# Altium schematic sheet S6_Can_SPI_Uart_Ports.SchDoc
size 420 x 297 mm; SheetNumber: 6; SheetTotal: 7
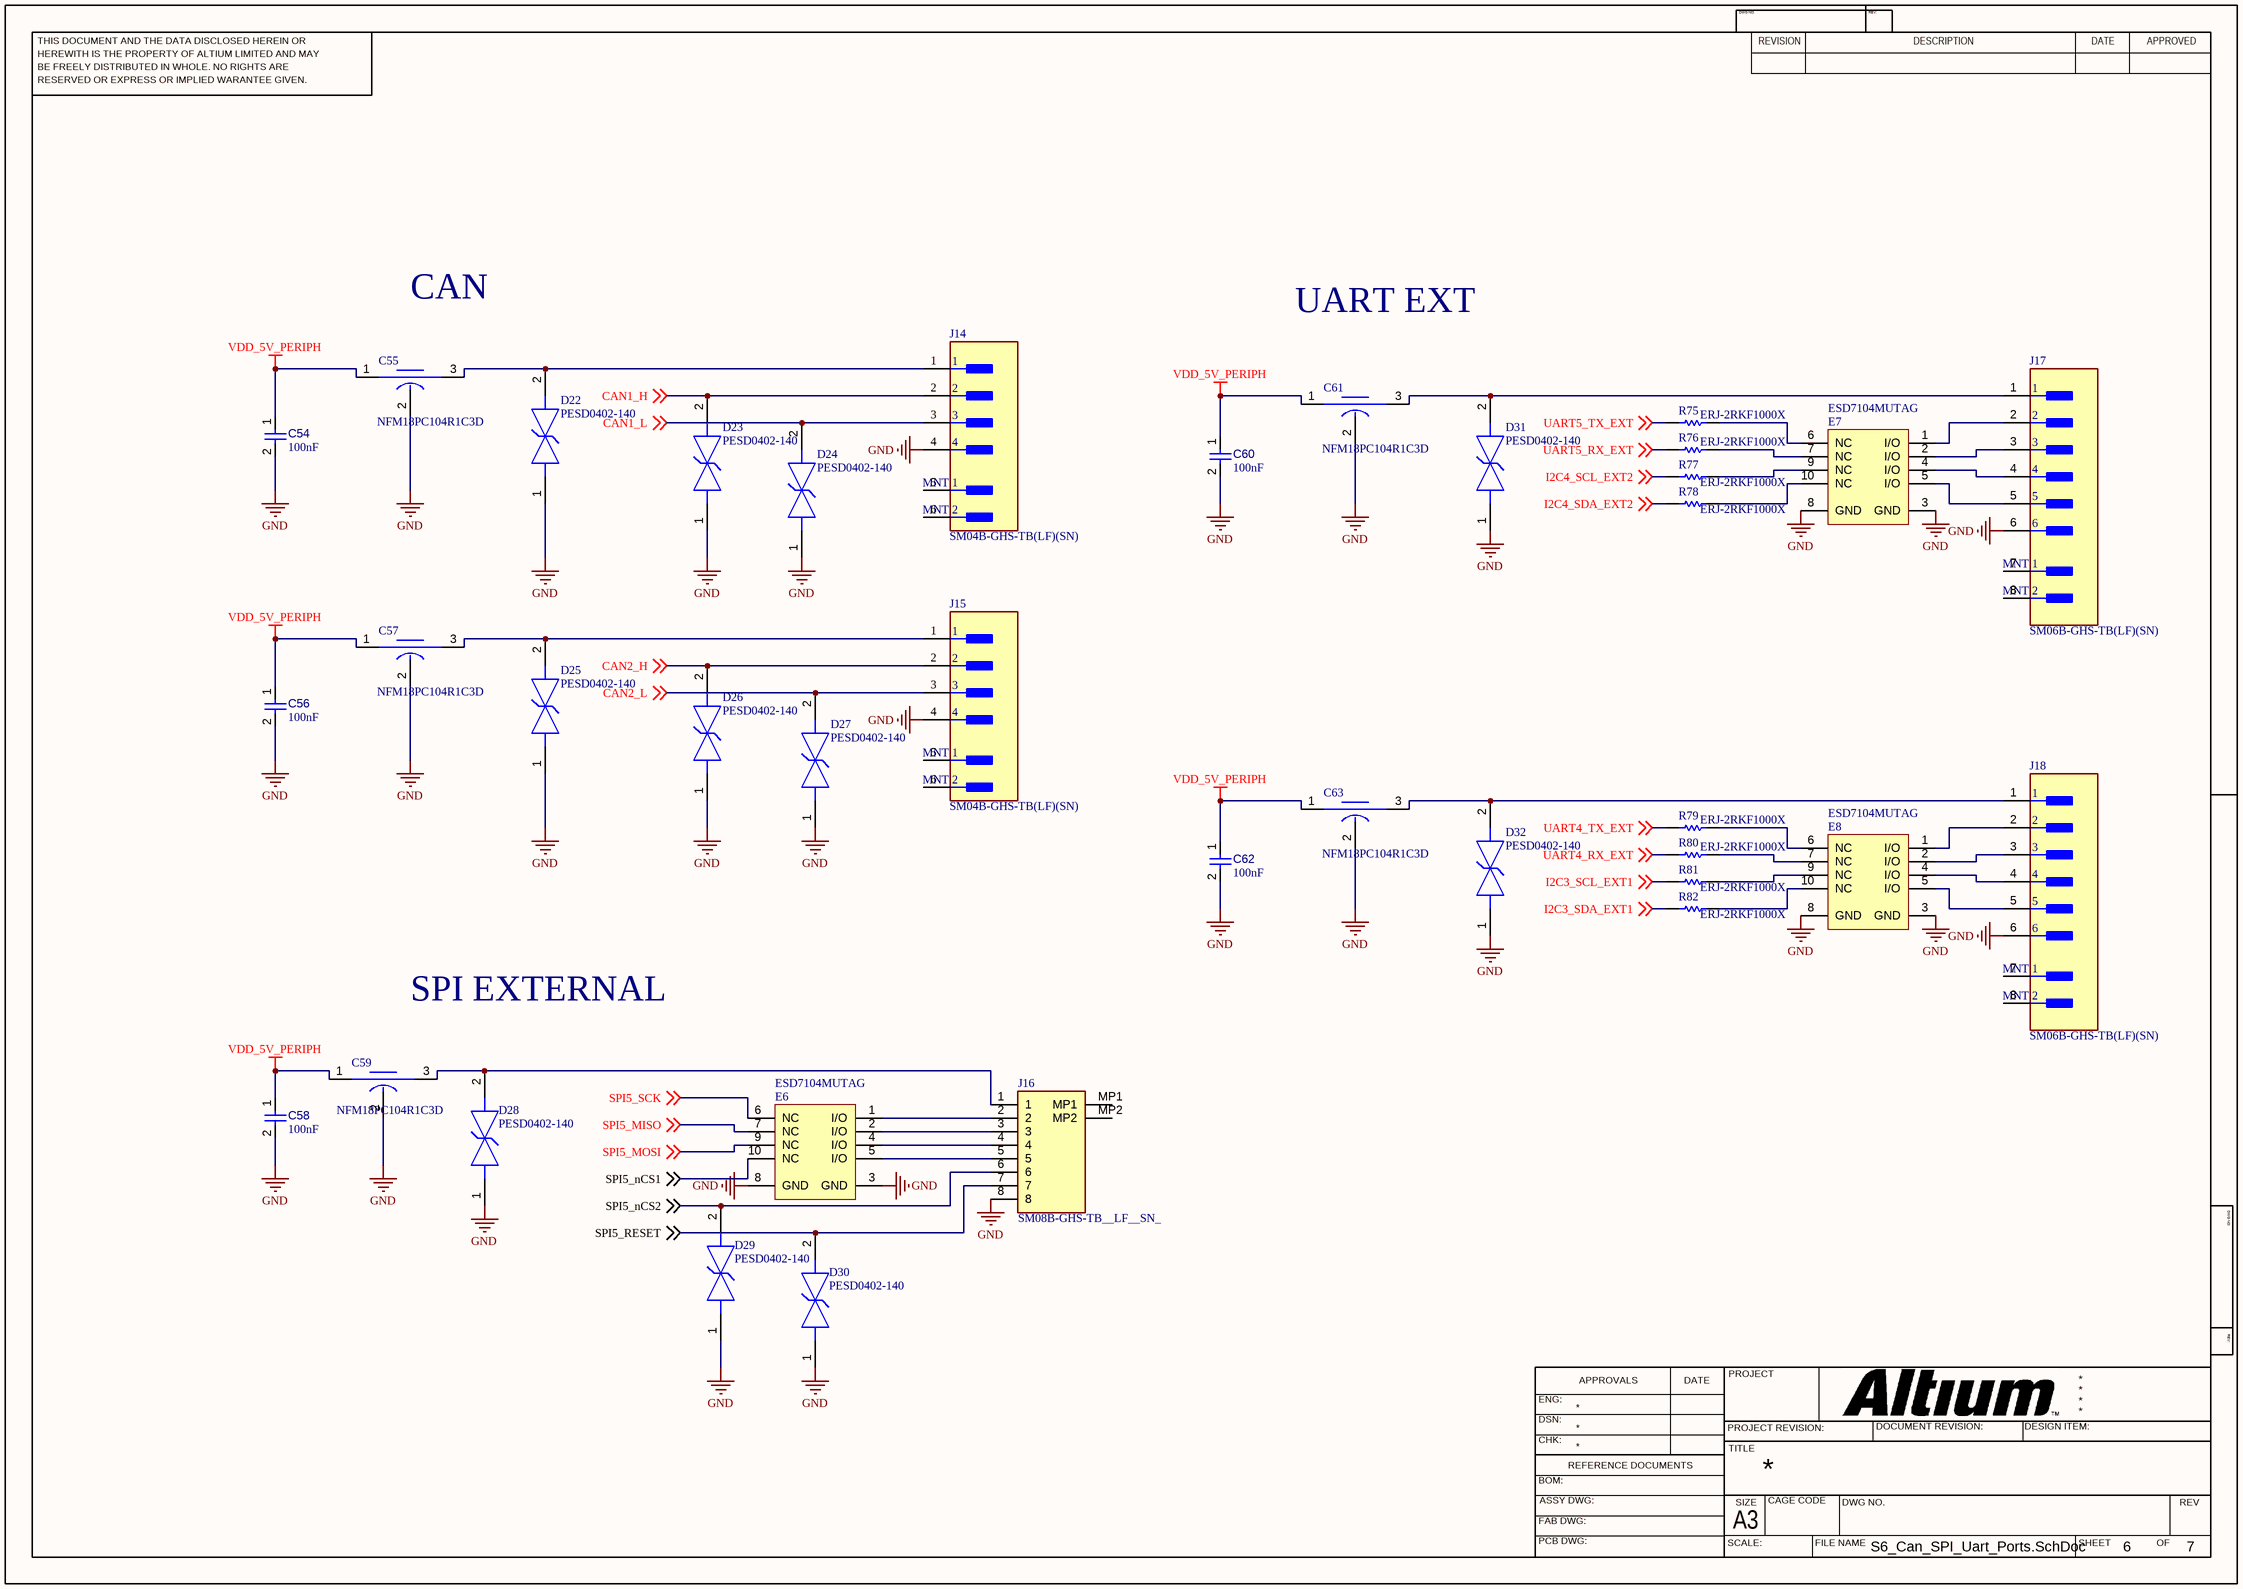
[diagram p0: S6_Can_SPI_Uart_Ports.SchDoc]

## Parts
C54  value 100nF  [CAPC0402(1005)60_L]  (hidden comment: Capacitor 100nF +/-20% 25V 0402)
C55  NFM18PC104R1C3D  [FP-NFM18-0_1-e0_15_0_35-MFG]
C56  value 100nF  [CAPC0402(1005)60_L]  (hidden comment: Capacitor 100nF +/-20% 25V 0402)
C57  NFM18PC104R1C3D  [FP-NFM18-0_1-e0_15_0_35-MFG]
C58  value 100nF  [CAPC0402(1005)60_L]  (hidden comment: Capacitor 100nF +/-20% 25V 0402)
C59  NFM18PC104R1C3D  [FP-NFM18-0_1-e0_15_0_35-MFG]
C60  value 100nF  [CAPC0402(1005)60_L]  (hidden comment: Capacitor 100nF +/-20% 25V 0402)
C61  NFM18PC104R1C3D  [FP-NFM18-0_1-e0_15_0_35-MFG]
C62  value 100nF  [CAPC0402(1005)60_L]  (hidden comment: Capacitor 100nF +/-20% 25V 0402)
C63  NFM18PC104R1C3D  [FP-NFM18-0_1-e0_15_0_35-MFG]
D22  PESD0402-140  [FP-PESD0402-MFG]
D23  PESD0402-140  [FP-PESD0402-MFG]
D24  PESD0402-140  [FP-PESD0402-MFG]
D25  PESD0402-140  [FP-PESD0402-MFG]
D26  PESD0402-140  [FP-PESD0402-MFG]
D27  PESD0402-140  [FP-PESD0402-MFG]
D28  PESD0402-140  [FP-PESD0402-MFG]
D29  PESD0402-140  [FP-PESD0402-MFG]
D30  PESD0402-140  [FP-PESD0402-MFG]
D31  PESD0402-140  [FP-PESD0402-MFG]
D32  PESD0402-140  [FP-PESD0402-MFG]
E6  ESD7104MUTAG  [ONSC-UDFN-10-517BB-01_V]
E7  ESD7104MUTAG  [ONSC-UDFN-10-517BB-01_V]
E8  ESD7104MUTAG  [ONSC-UDFN-10-517BB-01_V]
J14  SM04B-GHS-TB(LF)(SN)  [FP-SM04B-GHS-TB_LF_SN-MFG]
J15  SM04B-GHS-TB(LF)(SN)  [FP-SM04B-GHS-TB_LF_SN-MFG]
J16  SM08B-GHS-TB__LF__SN_  [SM08BGHSTBLFSN]
J17  SM06B-GHS-TB(LF)(SN)  [FP-SM06B-GHS-TB_LF_SN-MFG]
J18  SM06B-GHS-TB(LF)(SN)  [FP-SM06B-GHS-TB_LF_SN-MFG]
R75  ERJ-2RKF1000X  [RESC1005X40X25LL05T05]
R76  ERJ-2RKF1000X  [RESC1005X40X25LL05T05]
R77  ERJ-2RKF1000X  [RESC1005X40X25LL05T05]
R78  ERJ-2RKF1000X  [RESC1005X40X25LL05T05]
R79  ERJ-2RKF1000X  [RESC1005X40X25LL05T05]
R80  ERJ-2RKF1000X  [RESC1005X40X25LL05T05]
R81  ERJ-2RKF1000X  [RESC1005X40X25LL05T05]
R82  ERJ-2RKF1000X  [RESC1005X40X25LL05T05]

## Nets
GND: C54.2 C55.2(GND) C56.2 C57.2(GND) C58.2 C59.2(GND) C60.2 C61.2(GND) C62.2 C63.2(GND) D22.1 D23.1 D24.1 D25.1 D26.1 D27.1 D28.1 D29.1 D30.1 D31.1 D32.1 E6.3(GND) E6.8(GND) E7.3(GND) E7.8(GND) E8.3(GND) E8.8(GND) J14.4 J15.4 J16.8 J17.6 J18.6
VDD_5V_PERIPH: C54.1 C55.1(Input) C56.1 C57.1(Input) C58.1 C59.1(Input) C60.1 C61.1(Input) C62.1 C63.1(Input)
CAN1_H: D23.2 J14.2 ; off-sheet CAN1_H
CAN1_L: D24.2 J14.3 ; off-sheet CAN1_L
CAN2_H: D26.2 J15.2 ; off-sheet CAN2_H
CAN2_L: D27.2 J15.3 ; off-sheet CAN2_L
I2C3_SCL_EXT1: R81.1 ; off-sheet I2C3_SCL_EXT1
I2C3_SDA_EXT1: R82.1 ; off-sheet I2C3_SDA_EXT1
I2C4_SCL_EXT2: R77.1 ; off-sheet I2C4_SCL_EXT2
I2C4_SDA_EXT2: R78.1 ; off-sheet I2C4_SDA_EXT2
SPI5_MISO: E6.7(NC) ; off-sheet SPI5_MISO
SPI5_MOSI: E6.9(NC) ; off-sheet SPI5_MOSI
SPI5_nCS1: E6.10(NC) ; off-sheet SPI5_nCS1
SPI5_nCS2: D29.2 J16.6 ; off-sheet SPI5_nCS2
SPI5_RESET: D30.2 J16.7 ; off-sheet SPI5_RESET
SPI5_SCK: E6.6(NC) ; off-sheet SPI5_SCK
UART4_RX_EXT: R80.1 ; off-sheet UART4_RX_EXT
UART4_TX_EXT: R79.1 ; off-sheet UART4_TX_EXT
UART5_RX_EXT: R76.1 ; off-sheet UART5_RX_EXT
UART5_TX_EXT: R75.1 ; off-sheet UART5_TX_EXT
NetC55_3: C55.3(Output) D22.2 J14.1
NetC57_3: C57.3(Output) D25.2 J15.1
NetC59_3: C59.3(Output) D28.2 J16.1
NetC61_3: C61.3(Output) D31.2 J17.1
NetC63_3: C63.3(Output) D32.2 J18.1
NetE6_1: E6.1(I/O) J16.2
NetE6_2: E6.2(I/O) J16.3
NetE6_4: E6.4(I/O) J16.4
NetE6_5: E6.5(I/O) J16.5
NetE7_1: E7.1(I/O) J17.2
NetE7_2: E7.2(I/O) J17.3
NetE7_4: E7.4(I/O) J17.4
NetE7_5: E7.5(I/O) J17.5
NetE7_6: E7.6(NC) R75.2
NetE7_7: E7.7(NC) R76.2
NetE7_9: E7.9(NC) R77.2
NetE7_10: E7.10(NC) R78.2
NetE8_1: E8.1(I/O) J18.2
NetE8_2: E8.2(I/O) J18.3
NetE8_4: E8.4(I/O) J18.4
NetE8_5: E8.5(I/O) J18.5
NetE8_6: E8.6(NC) R79.2
NetE8_7: E8.7(NC) R80.2
NetE8_9: E8.9(NC) R81.2
NetE8_10: E8.10(NC) R82.2

Not connected (* = marked no-connect by the designer): J14 5(MNT_1) 6(MNT_2); J15 5(MNT_1) 6(MNT_2); J16 MP1 MP2; J17 7(MNT_1) 8(MNT_2); J18 7(MNT_1) 8(MNT_2)

## Notes on the sheet
- CAN
- UART EXT
- SPI EXTERNAL
- THIS DOCUMENT AND THE DATA DISCLOSED HEREIN OR
- HEREWITH IS THE PROPERTY OF ALTIUM LIMITED AND MAY
- DWG NO:
- REVISION
- REV:
- DESCRIPTION
- DATE
- APPROVED
- BE FREELY DISTRIBUTED IN WHOLE. NO RIGHTS ARE
- RESERVED OR EXPRESS OR IMPLIED WARANTEE GIVEN.
- ENG:
- APPROVALS
- PROJECT
- DSN:
- CHK:
- REFERENCE DOCUMENTS
- PROJECT REVISION:
- TITLE
- DOCUMENT REVISION:
- DESIGN ITEM:
- BOM:
- FAB DWG:
- PCB DWG:
- ASSY DWG:
- SCALE:
- A3
- SIZE
- CAGE CODE
- FILE NAME
- DWG NO.
- SHEET
- OF
- REV

## Library data of the parts
C54 C56 C58 C60 C62 = CMP-001-00065-4: Chip Capacitor, 100nF +/-20%, 25V, 0402, Thickness 0.6 mm; Tolerance: 10%; Max Operating Temperature: 85°C; Min Operating Temperature: -55°C; Pins: 2; Voltage Rating: 25V; Mounting Technology: SMT; Case/Package: 0402
C55 C57 C59 C61 C63 = CMP-06053-000054-1: Large Current 3 Terminals Low ESL Chip Multilayer Ceramic Capacitors for General Purpose, 0603, 0.10uF, 20%, 16V; Capacitance: 100nF; Insulation Resistance: 1GR; Current Rating: 2A; DC Resistance (DCR): 30mR; Case Code (Imperial): 0603; REACH SVHC: No SVHC; Width: 0.8mm; Case Code (Metric): 1608; Voltage Rating (DC): 16V; Case/Package: 0603; Packaging: Tape and Reel; Length: 1.6mm; Height: 0.6mm; Voltage: 16V; Depth: 0.8mm; Radiation Hardening: No; Max Operating Temperature: 125°C; Max Voltage Rating (DC): 16V; Voltage Rating: 16V; Max Current Rating: 2A; Tolerance: 20%; Min Operating Temperature: -55°C; Mount: PCB; Termination: Flat; Current: 2A; Package Quantity: 4000; Lead Free: Lead Free
D22-D32 = CMP-08607-000011-1: TVS DIODE 14V 40V 0402; Manufacturer: Littelfuse Inc.; Automotive Grade: Grade 1; Capacitance: 0.25pF; Value: 0.25pF; Direction: Bidirectional; Number Of Channels: 1; Temperature Range Low: -55°C; Lead Free: Yes; Temperature: -55°C to +125°C; Digikey Description: TVS DIODE 14V 40V 0402; Automotive: Yes; Device Class L2: TVS Diodes; Reverse Standoff Voltage: 14V; Device Class L1: Circuit Protection; Ipc Land Pattern Name: DIOC10050X33; Manufacturer Part Number: PESD0402-140; Breakdown Voltage: 14V; Height: 0.43mm; Clamping Voltage: 40V; RoHS: TRUE; Temperature Range High: +125°C; Device Class L3: unset; Octopart: https://octopart.com/pesd0402-140-littelfuse-74215061; Package: PESD0402; ComponentLink2URL: https://www.littelfuse.com/~/media/electronics/datasheets/polymer_esd_suppressors/littelfuse_polymer_esd_suppressor_pesd_catalog_datasheet.pdf.pdf; Category: Diode; ComponentLink2Description: Datasheet
E6-E8 = CMP-1063-00242-1: Transient Voltage Suppressor, Low Capacitance ESD Protection for High Speed Data, 10-Pin UDFN, Pb-Free, Tape and Reel; Manufacturer: On Semiconductor; IR Max (uA): 1; Number of Lines: 4; VRWM Max (V): 5; Direction: Bidirectional; V(BR) Min (V): 5.5; PackageDescription: 10-Pin Small Outline No-Lead, Body 2.5 x 1 mm, Pitch 0.5 mm; ComponentLink3URL: http://www.onsemi.com/pub_link/Collateral/517BB.PDF; PackageReference: UDFN-10-517BB-01; Mounting Technology: Surface Mount; PartNumber: ESD7104MUTAG; ComponentLink1URL: http://www.onsemi.com/; ComponentLink1Description: Manufacturer URL; DatasheetVersion: Rev. 2; ComponentLink2Description: Datasheet; ComponentLink2URL: http://www.onsemi.cn/pub_link/Collateral/ESD7104-D.PDF; PackageVersion: Rev. O, 11/2009; Packing: Tape and Reel; RoHS: Pb-Free; ComponentLink3Description: Package Specification
J14 J15 = CMP-17439-000411-1: CONN HEADER SMD R/A 4POS 1.25MM; Voltage Rating: 50V; Number of Contacts: 4; Current Rating: 1A; Termination: Solder; Mount: Surface Mount; REACH SVHC: No SVHC; Packaging: Cut Tape; Contact Material: Bronze; Series: GH; Orientation: Right Angle; Lead Free: Lead Free; Housing Material: Nylon; Contact Plating: Tin; Housing Color: Natural; Number of Rows: 1; Pitch: 1.25mm; Number of Positions: 4
J16 = SM08B-GHS-TB__LF__SN_: Connector; Manufacturer_Name: JST (JAPAN SOLDERLESS TERMINALS); Manufacturer_Part_Number: SM08B-GHS-TB (LF)(SN); Datasheet Link: https://www.arrow.com/en/products/sm08b-ghs-tb-lf-sn/jst-manufacturing; Height: 4.25mm; Arrow Part Number: SM08B-GHS-TB (LF)(SN); Arrow Price/Stock: https://www.arrow.com/en/products/sm08b-ghs-tb-lf-sn/jst-manufacturing
J17 J18 = CMP-17439-000061-1: CONN HEADER SMD R/A 6POS 1.25MM; Number of Contacts: 6; Voltage Rating: 50V; Current Rating: 1A; Connector Type: Outer Shroud Contact; Contact Resistance: 50mR; Orientation: Right Angle; Max Operating Temperature: 85°C; Mount: Surface Mount; Packaging: Tape and Reel; Contact Plating: Tin; Depth: 4.05mm; Max Voltage Rating (AC): 50V; Lead Free: Lead Free; Pitch: 1.25mm; Number of Positions: 6; Max Current Rating: 1A; Termination: Solder; Min Operating Temperature: -25°C; Housing Color: Beige; Fastening Type: Ramp; Length: 10.75mm; Color: Natural; Contact Material: Bronze; Housing Material: Polyamide; Number of Rows: 1
R75-R82 = CMP-2002-00605-3: Chip Resistor, 100 Ohm, +/- 1%, 100 mW, -55 to 155 degC, 0402 (1005 Metric), RoHS, Tape and Reel; Manufacturer: Basic Passives; Power Rating: 100 mW; Resistance: 100 Ohm; Voltage Rating: 50 V; Case\/Package: 0402; Width: 0.5 mm; Pins: 2; ComponentLink2Description: Datasheet; PackageReference: 0402; Height: 0.35 mm; Tolerance: 1%; DatasheetVersion: 04/2015; Case Code (Imperial): 0402; Min Operating Temperature: -55 degC; Radiation Hardening: No; Length: 1 mm; Package Quantity: 10000; PackageDescription: 2-Pin Surface Mount Device, Body 1 x 0.5 mm; Mounting Technology: Surface Mount; Case Code (Metric): 1005; Packaging: Tape and Reel; ComponentLink1URL: http://www.panasonic.com/; RoHSCompliant: true; Max Operating Temperature: 155 degC; REACH SVHC: Yes; PartNumber: ERJ-2RKF1000X; ComponentLink1Description: Manufacturer URL; ComponentLink2URL: http://industrial.panasonic.com/cdbs/www-data/pdf/RDA0000/AOA0000C86.pdf; Mount: Surface Mount